# Altium schematic sheet MainCtrl.SchDoc
size A3; SheetNumber: 3; SheetTotal: 3
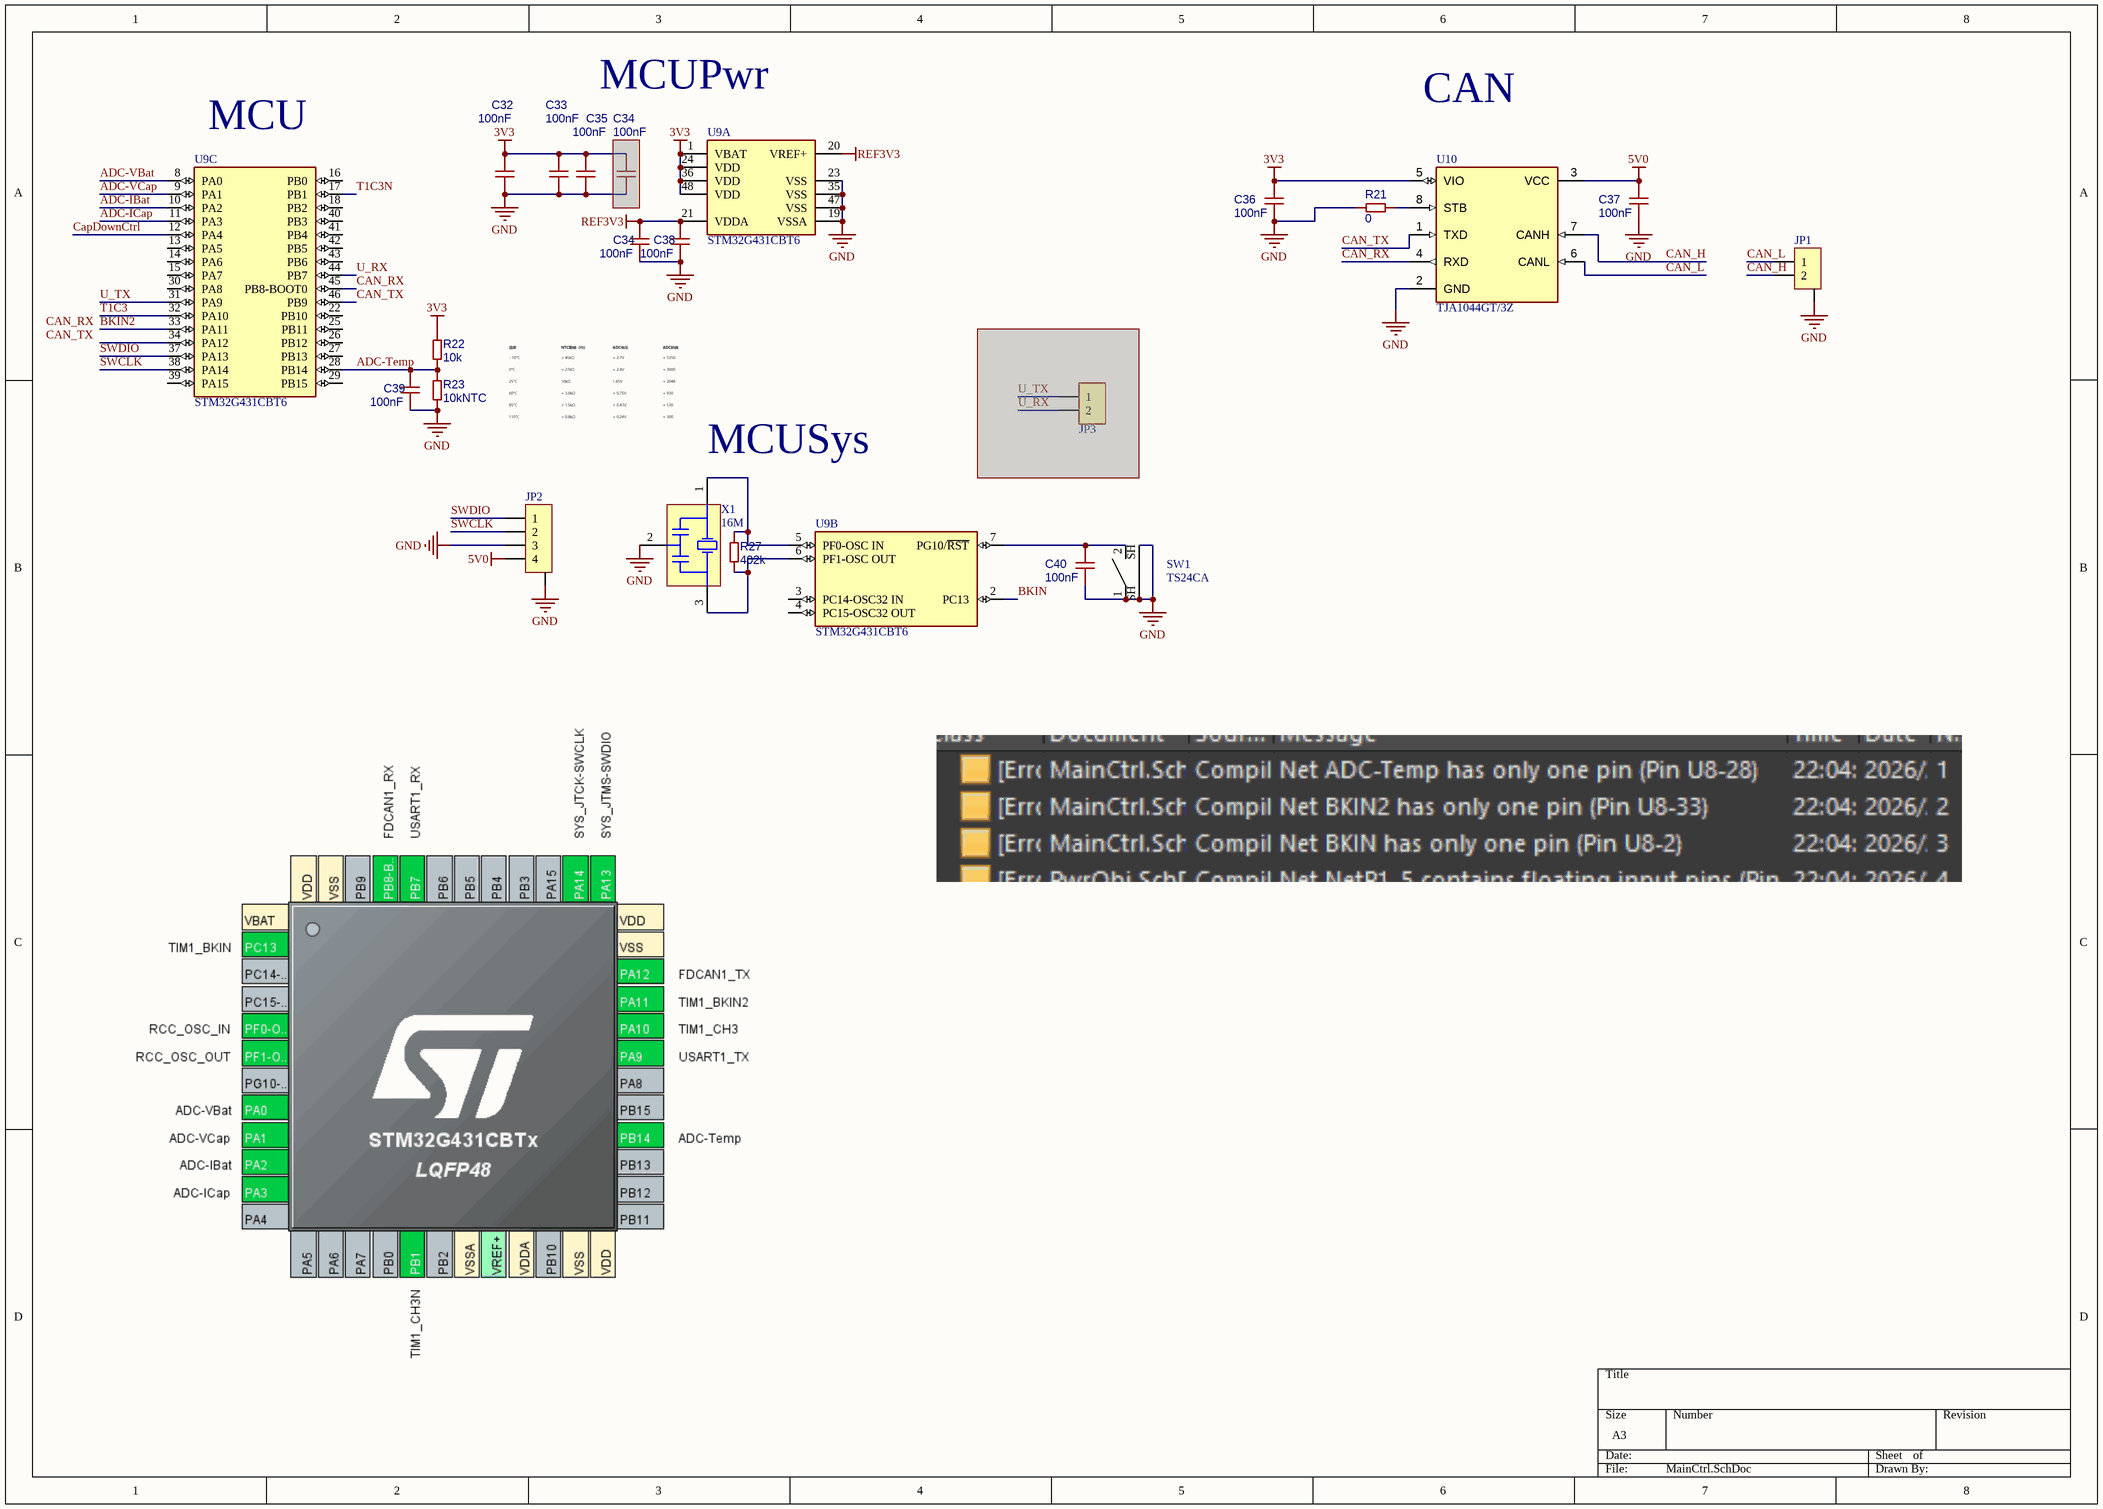
[diagram p0: MainCtrl.SchDoc]

## Parts
(Parts that share a designator on the sheet are numbered #1, #2 ... from top to bottom, then left to right.)
C32  100nF  [0603M]
C33  100nF  [0603M]
C34#1  100nF  [0603M]  (masked out: inside a compile mask, not in the netlist)
C34#2  100nF  [0603M]
C35  100nF  [0603M]
C36  100nF  [0603M]
C37  100nF  [0603M]
C38  100nF  [0603M]
C39  100nF  [0603M]
C40  100nF  [0603M]
JP1  NHS-1.25Conn-2p  [GH1.25-2p-LT]  (value not drawn)
JP2  NHS-1.25Conn-4p  [MX1.25-WT]  (value not drawn)
JP3  HDR-1X2  [HDR2.54-LI-2P]  (value not drawn)  (masked out: inside a compile mask, not in the netlist)
R21  0  [0603M]
R22  10k  [0603M]
R23  10kNTC  [0603M]
R27  402k  [0603M]
SW1  TS24CA  [TS24CA-Footprint-1]
U9  STM32G431CBT6  [FP-LQFP48-5B-IPC_A]  (parts A,B,C of 3)
U10  TJA1044GT/3Z  [FP-SOT96-1-MFG]
X1  16M  [MURA-CSTCE_G_A-3_V]

## Nets
3V3: C32.1 C33.1 C35.1 C36.1 R22.1 U9.1(VBAT) U9.24(VDD) U9.36(VDD) U9.48(VDD) U10.5(VIO)
5V0: C37.1 JP2.4 U10.3(VCC)
GND: C32.2 C33.2 C34#2.2 C35.2 C36.2 C37.2 C38.2 C39.2 C40.1 JP1.0 JP2.0 JP2.3 R21.2 R23.2 SW1.1 SW1.SH U9.19(VSSA) U9.23(VSS) U9.35(VSS) U9.47(VSS) U10.2(GND) X1.2(GND)
REF3V3: C34#2.1 C38.1 U9.20(VREF+) U9.21(VDDA)
ADC-IBat: U9.10(PA2)
ADC-ICap: U9.11(PA3)
ADC-Temp: C39.1 R22.2 R23.1 U9.28(PB14)
ADC-VBat: U9.8(PA0)
ADC-VCap: U9.9(PA1)
BKIN: U9.2(PC13)
BKIN2: U9.33(PA11)
CAN_H: JP1.2 U10.7(CANH)
CAN_L: JP1.1 U10.6(CANL)
CAN_RX: U9.45(PB8-BOOT0) U10.4(RXD)
CAN_TX: U9.46(PB9) U10.1(TXD)
CapDownCtrl: U9.12(PA4)
SWCLK: JP2.2 U9.38(PA14)
SWDIO: JP2.1 U9.37(PA13)
T1C3: U9.32(PA10)
T1C3N: U9.17(PB1)
U_RX: U9.44(PB7)
U_TX: U9.31(PA9)
NetC40_2: C40.2 SW1.2 U9.7(PG10/~{RST})
NetR21_1: R21.1 U10.8(STB)
NetR27_1: R27.1 U9.5(PF0-OSC_IN) X1.1(X1)
NetR27_2: R27.2 U9.6(PF1-OSC_OUT) X1.3(X2)

Not connected (* = marked no-connect by the designer): U9 3(PC14-OSC32_IN) 4(PC15-OSC32_OUT) 13(PA5) 14(PA6) 15(PA7) 16(PB0) 18(PB2) 22(PB10) 25(PB11) 26(PB12) 27(PB13) 29(PB15) 30(PA8) 34(PA12) 39(PA15) 40(PB3) 41(PB4) 42(PB5) 43(PB6)

## Notes on the sheet
- MCUPwr
- CAN
- (near U9) MCU
- (near X1) MCUSys
- Labels drawn without touching a wire or pin: CAN_RX, CAN_TX

## Library data of the parts
C32 C33 C34#1 C34#2 C35-C40 = CMP-001-00098-4: ..
JP1 = CMP-002-00099-4: 1
JP2 = CMP-002-00101-3: ..
JP3 = Header 2: 2P接插件; 联系卖家，免费查找封装: 唯一出售店铺网址https://shop463601444.taobao.com; 封装库来自淘宝卖家ID：黄晶宝石: 其他店铺购入均为盗版封装库，请立即申请退款，本店现金奖励50~200元; BOM名称: 2P接插件
R21 R22 = CMP-009-00191-3: ..
R23 R27 = CMP-009-00191-3: C49247665
SW1 = CMP-011-00013-1: 4.55mm卧贴按钮
U9 = CMP-020-00041-2: Functional Parted Symbol; Interface: USB; Clock Frequency: 48MHz; Min Supply Voltage: 1.71V; Max Supply Voltage: 3.6V; Frequency: 170MHz; RAM Size: 32kB; Min Operating Temperature: -40°C; Max Operating Temperature: 85°C
U10 = CMP-015-00017-1: CAN High Speed Transceiver 5Mbps Normal/Standby 4.75V to 5.25V 8-Pin SOIC T/R; Min Supply Voltage: 4.75V; Max Operating Temperature: 150°C; Max Supply Voltage: 5.25V; Min Operating Temperature: -40°C
X1 = CMP-003-00002-2: Ceramic Resonator, 8 MHz, +/- 0.5%, 30/33/39 pF, -20 to 80 degC, 3-Pin SMD, RoHS, Tape and Reel; Manufacturer: Murata; Impedance: 40Ohm; Frequency: 8MHz; Load Capacitance: 33pF; Packaging: TapeandReel; Datasheet URL: http://www.murata.com/~/media/webrenewal/support/library/catalog/products/timingdevice/ceralock/p16e.ashx; Package Reference: CSTCE_G_A-3; Min Operating Temperature: -20°C; Manufacturer URL: http://www.murata.com/; Pins: 3; Tolerance: 0.5%; Self Resonant Frequency: 8MHz; Package Description: 3-Pin Surface Mount Device, Body 3.2 x 1.3 mm, Pitch 1.2 mm; Mounting Technology: SM; RoHS Compliant: True; Datasheet Version: Dec-15; Package Quantity: 1; Case/Package: CSMD; Max Operating Temperature: 80°C; Frequency Tolerance: 0.5%